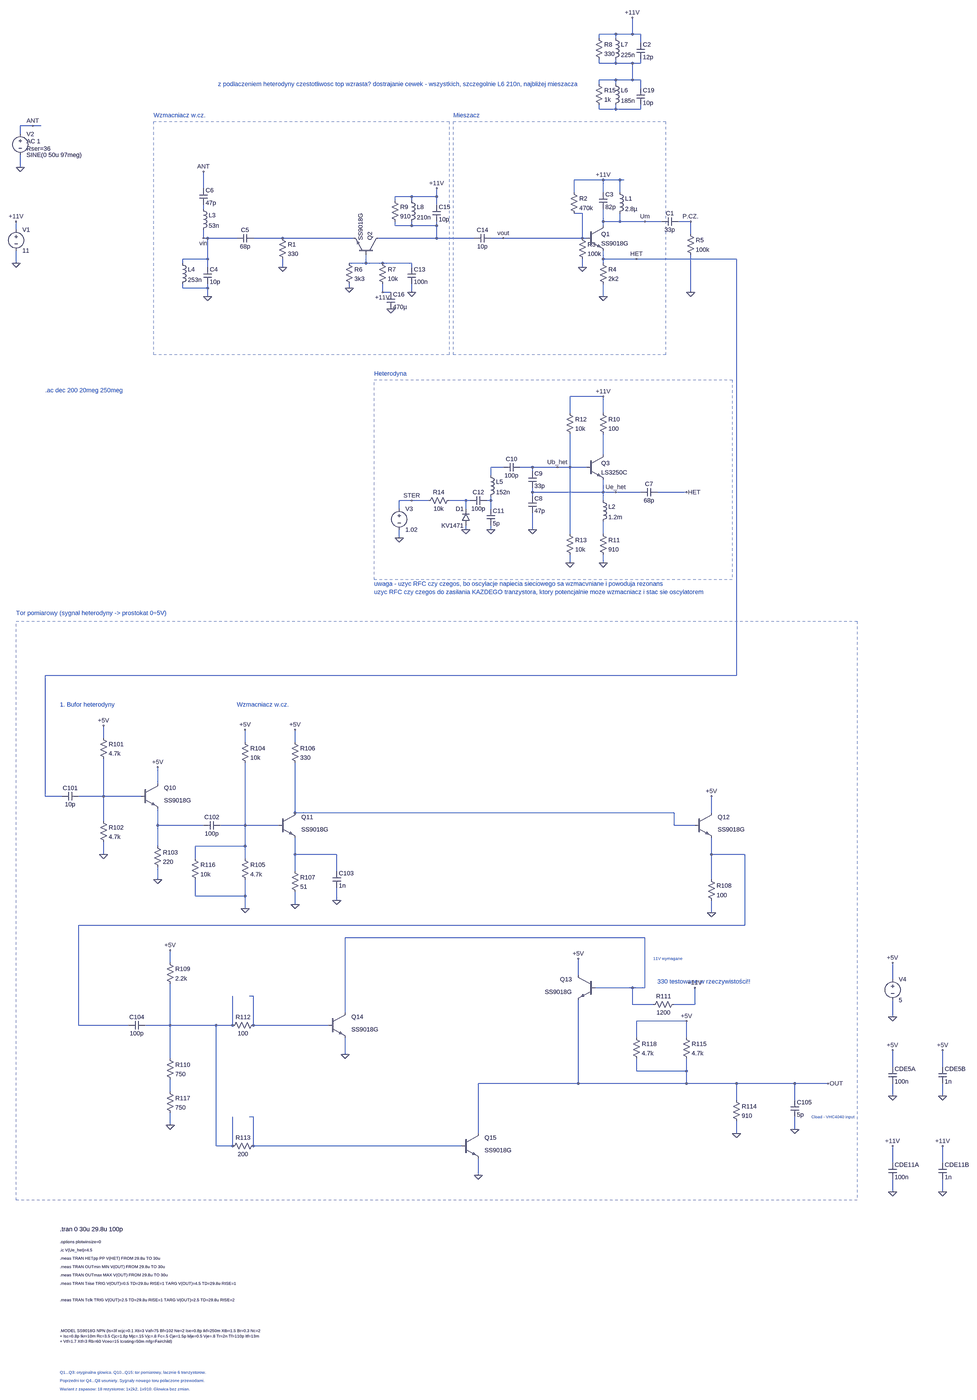
[diagram p0: schematic gt4_5.asc, whole sheet]
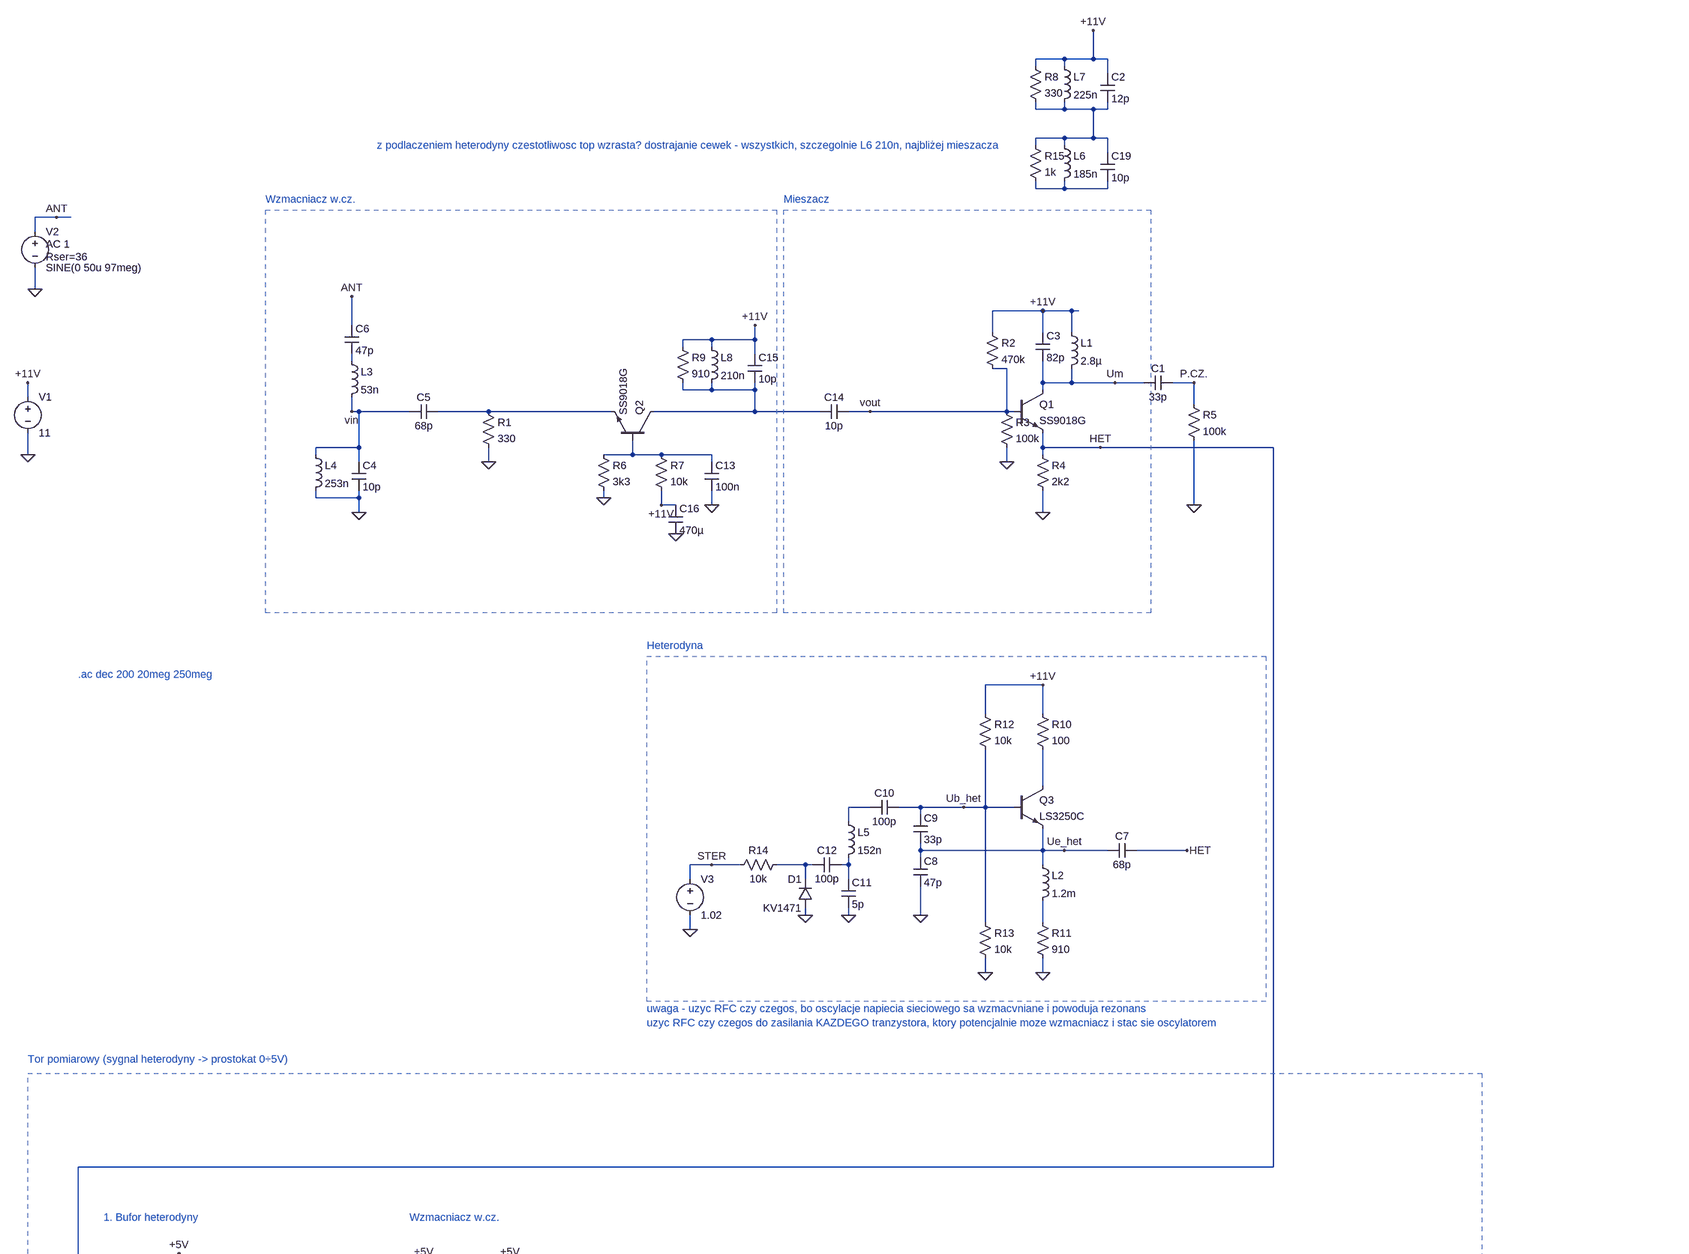
[diagram p1: schematic gt4_5.asc, part, row 1 of 2, column 1 of 1]
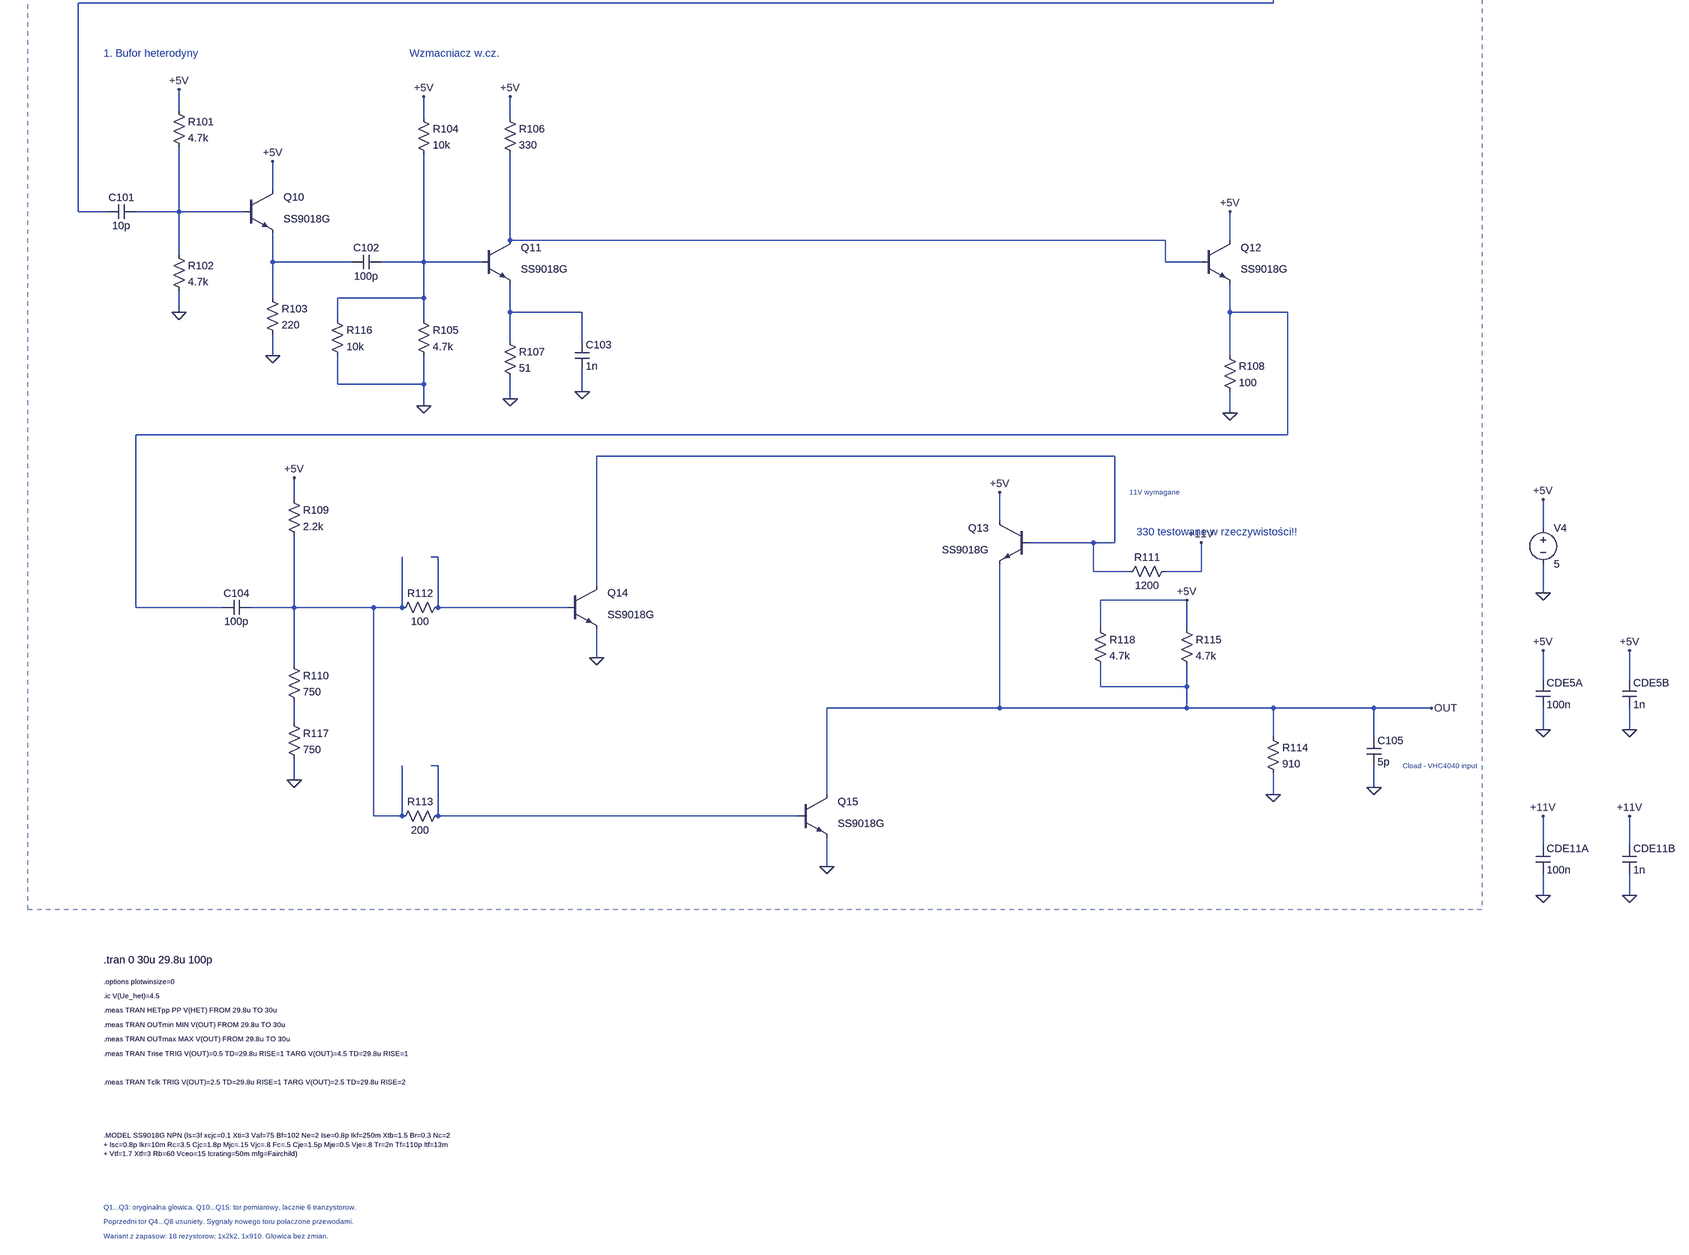
[diagram p2: schematic gt4_5.asc, part, row 2 of 2, column 1 of 1]
gt4_5.asc, the LTspice schematic file:
Version 4.1
SHEET 1 4160 5600
WIRE 336 -608 272 -608
WIRE 400 -608 400 -672
WIRE 400 -608 336 -608
WIRE 432 -608 400 -608
WIRE 272 -592 272 -608
WIRE 336 -592 336 -608
WIRE 432 -576 432 -608
WIRE 272 -496 272 -512
WIRE 336 -496 336 -512
WIRE 336 -496 272 -496
WIRE 400 -496 336 -496
WIRE 432 -496 432 -512
WIRE 432 -496 400 -496
WIRE 336 -432 272 -432
WIRE 400 -432 400 -496
WIRE 400 -432 336 -432
WIRE 432 -432 400 -432
WIRE 272 -416 272 -432
WIRE 336 -416 336 -432
WIRE 432 -400 432 -432
WIRE 272 -320 272 -336
WIRE 336 -320 336 -336
WIRE 336 -320 272 -320
WIRE 432 -320 432 -336
WIRE 432 -320 336 -320
WIRE -1904 -256 -1952 -256
WIRE -1872 -256 -1904 -256
WIRE -1952 -224 -1952 -256
WIRE -1952 -96 -1952 -144
WIRE 288 -48 176 -48
WIRE 352 -48 288 -48
WIRE 368 -48 352 -48
WIRE -1248 -16 -1248 -80
WIRE 176 0 176 -48
WIRE 288 0 288 -48
WIRE 352 0 352 -48
WIRE -448 16 -512 16
WIRE -352 16 -352 -16
WIRE -352 16 -448 16
WIRE -512 32 -512 16
WIRE -448 32 -448 16
WIRE -352 48 -352 16
WIRE -1248 64 -1248 48
WIRE 208 80 176 80
WIRE 288 112 288 64
WIRE 352 112 352 80
WIRE 352 112 288 112
WIRE 448 112 352 112
WIRE 512 112 448 112
WIRE 624 112 576 112
WIRE -512 128 -512 112
WIRE -448 128 -448 112
WIRE -448 128 -512 128
WIRE -352 128 -352 112
WIRE -352 128 -448 128
WIRE 288 128 288 112
WIRE -1968 144 -1968 112
WIRE 624 160 624 112
WIRE -1248 176 -1248 144
WIRE -1232 176 -1248 176
WIRE -1120 176 -1232 176
WIRE -944 176 -1056 176
WIRE -672 176 -944 176
WIRE -352 176 -352 128
WIRE -352 176 -576 176
WIRE -208 176 -352 176
WIRE -96 176 -144 176
WIRE 208 176 208 80
WIRE 208 176 -96 176
WIRE 224 176 208 176
WIRE -1232 256 -1232 176
WIRE -1232 256 -1328 256
WIRE 288 256 288 224
WIRE 416 256 288 256
WIRE 800 256 416 256
WIRE -1968 272 -1968 224
WIRE -1328 272 -1328 256
WIRE -624 272 -624 240
WIRE -624 272 -688 272
WIRE -560 272 -624 272
WIRE -448 272 -560 272
WIRE 288 272 288 256
WIRE -1232 288 -1232 256
WIRE -944 288 -944 256
WIRE -448 288 -448 272
WIRE 208 288 208 256
WIRE -1328 368 -1328 352
WIRE -1232 368 -1232 352
WIRE -1232 368 -1328 368
WIRE -688 368 -688 352
WIRE -560 384 -560 352
WIRE -528 384 -560 384
WIRE -448 384 -448 352
WIRE 624 384 624 240
WIRE -1232 400 -1232 368
WIRE 288 400 288 352
WIRE 288 784 160 784
WIRE 160 848 160 784
WIRE 288 848 288 784
WIRE 288 1008 288 928
WIRE -96 1056 -144 1056
WIRE 16 1056 -32 1056
WIRE 112 1056 16 1056
WIRE 160 1056 160 928
WIRE 160 1056 112 1056
WIRE 224 1056 160 1056
WIRE 16 1072 16 1056
WIRE -144 1088 -144 1056
WIRE 16 1152 16 1136
WIRE 288 1152 288 1104
WIRE 288 1152 16 1152
WIRE 336 1152 288 1152
WIRE 432 1152 336 1152
WIRE 608 1152 496 1152
WIRE 16 1168 16 1152
WIRE -448 1184 -496 1184
WIRE -384 1184 -448 1184
WIRE -240 1184 -304 1184
WIRE -224 1184 -240 1184
WIRE -144 1184 -144 1168
WIRE -144 1184 -160 1184
WIRE 288 1184 288 1152
WIRE -496 1216 -496 1184
WIRE -240 1216 -240 1184
WIRE -144 1216 -144 1184
WIRE -240 1296 -240 1280
WIRE -144 1296 -144 1280
WIRE 16 1296 16 1232
WIRE 160 1312 160 1056
WIRE 288 1312 288 1264
WIRE -496 1328 -496 1296
WIRE 160 1424 160 1392
WIRE 288 1424 288 1392
WIRE 800 1856 800 256
WIRE 800 1856 -1856 1856
WIRE -1632 2096 -1632 2048
WIRE -1088 2112 -1088 2064
WIRE -896 2112 -896 2064
WIRE -1424 2272 -1424 2208
WIRE -1856 2320 -1856 1856
WIRE -1792 2320 -1856 2320
WIRE -1632 2320 -1632 2176
WIRE -1632 2320 -1728 2320
WIRE -1488 2320 -1632 2320
WIRE -896 2384 -896 2192
WIRE 560 2384 -896 2384
WIRE 704 2384 704 2320
WIRE -1632 2416 -1632 2320
WIRE -1424 2432 -1424 2368
WIRE -1248 2432 -1424 2432
WIRE -1088 2432 -1088 2192
WIRE -1088 2432 -1184 2432
WIRE -960 2432 -1088 2432
WIRE 560 2432 560 2384
WIRE 640 2432 560 2432
WIRE -1424 2512 -1424 2432
WIRE -1088 2512 -1088 2432
WIRE -1088 2512 -1280 2512
WIRE -1632 2544 -1632 2496
WIRE -896 2544 -896 2480
WIRE -736 2544 -896 2544
WIRE 704 2544 704 2480
WIRE 832 2544 704 2544
WIRE -1280 2560 -1280 2512
WIRE -1088 2560 -1088 2512
WIRE -896 2608 -896 2544
WIRE -736 2608 -736 2544
WIRE -1424 2640 -1424 2592
WIRE 704 2640 704 2544
WIRE -1280 2704 -1280 2640
WIRE -1088 2704 -1088 2640
WIRE -1088 2704 -1280 2704
WIRE -736 2720 -736 2672
WIRE -896 2736 -896 2688
WIRE -1088 2752 -1088 2704
WIRE 704 2768 704 2720
WIRE 832 2816 832 2544
WIRE 832 2816 -1728 2816
WIRE 448 2864 -704 2864
WIRE -1376 2960 -1376 2912
WIRE 192 3008 192 2944
WIRE 1440 3024 1440 2960
WIRE 400 3056 256 3056
WIRE 448 3056 448 2864
WIRE 448 3056 400 3056
WIRE -1056 3088 -1072 3088
WIRE 400 3120 400 3056
WIRE 480 3120 400 3120
WIRE 640 3120 640 3056
WIRE 640 3120 560 3120
WIRE -704 3152 -704 2864
WIRE 1440 3168 1440 3104
WIRE 608 3184 416 3184
WIRE -1728 3200 -1728 2816
WIRE -1536 3200 -1728 3200
WIRE -1376 3200 -1376 3040
WIRE -1376 3200 -1472 3200
WIRE -1200 3200 -1376 3200
WIRE -1136 3200 -1136 3088
WIRE -1136 3200 -1200 3200
WIRE -1056 3200 -1056 3088
WIRE -768 3200 -1056 3200
WIRE 416 3248 416 3184
WIRE 608 3248 608 3184
WIRE -704 3312 -704 3248
WIRE -1376 3328 -1376 3200
WIRE 1440 3360 1440 3296
WIRE 1632 3360 1632 3296
WIRE 416 3376 416 3328
WIRE 608 3376 608 3328
WIRE 608 3376 416 3376
WIRE 192 3424 192 3104
WIRE 192 3424 -192 3424
WIRE 608 3424 608 3376
WIRE 608 3424 192 3424
WIRE 800 3424 608 3424
WIRE 1024 3424 800 3424
WIRE 1152 3424 1024 3424
WIRE -1376 3456 -1376 3408
WIRE 1440 3472 1440 3424
WIRE 1632 3472 1632 3424
WIRE 800 3488 800 3424
WIRE 1024 3488 1024 3424
WIRE -1056 3552 -1072 3552
WIRE -1376 3584 -1376 3536
WIRE 1024 3600 1024 3552
WIRE -192 3616 -192 3424
WIRE 800 3616 800 3568
WIRE -1200 3664 -1200 3200
WIRE -1136 3664 -1136 3552
WIRE -1136 3664 -1200 3664
WIRE -1056 3664 -1056 3552
WIRE -256 3664 -1056 3664
WIRE 1440 3728 1440 3664
WIRE 1632 3728 1632 3664
WIRE -192 3776 -192 3712
WIRE 1440 3840 1440 3792
WIRE 1632 3840 1632 3792
FLAG 624 384 0
FLAG 288 400 0
FLAG -1968 272 0
FLAG -1968 112 +11V
FLAG -1952 -96 0
FLAG -96 176 vout
FLAG 288 -48 +11V
FLAG -1248 -80 ANT
FLAG 160 1424 0
FLAG 288 1424 0
FLAG 608 1152 HET
FLAG 416 256 HET
FLAG 16 1296 0
FLAG -144 1296 0
FLAG -240 1296 0
FLAG -496 1328 0
FLAG -448 1184 STER
FLAG 288 784 +11V
FLAG 112 1056 Ub_het
FLAG 336 1152 Ue_het
FLAG 624 112 P.CZ.
FLAG 208 288 0
FLAG 448 112 Um
FLAG -1248 176 vin
FLAG -1904 -256 ANT
FLAG -944 288 0
FLAG -1232 400 0
FLAG -688 368 0
FLAG -560 384 +11V
FLAG -448 384 0
FLAG 400 -672 +11V
FLAG -352 -16 +11V
FLAG -528 448 0
FLAG -1424 2208 +5V
FLAG -1632 2048 +5V
FLAG -1632 2544 0
FLAG -1424 2640 0
FLAG -1088 2064 +5V
FLAG -1088 2752 0
FLAG -896 2064 +5V
FLAG -896 2736 0
FLAG -736 2720 0
FLAG 704 2320 +5V
FLAG 704 2768 0
FLAG -1376 2912 +5V
FLAG -1376 3584 0
FLAG -704 3312 0
FLAG -192 3776 0
FLAG 192 2944 +5V
FLAG 1152 3424 OUT
FLAG 640 3056 +11V
FLAG 608 3184 +5V
FLAG 800 3616 0
FLAG 1024 3600 0
FLAG 1440 2960 +5V
FLAG 1440 3168 0
FLAG 1440 3296 +5V
FLAG 1440 3472 0
FLAG 1632 3296 +5V
FLAG 1632 3472 0
FLAG 1440 3664 +11V
FLAG 1440 3840 0
FLAG 1632 3664 +11V
FLAG 1632 3840 0
SYMBOL npn 224 128 R0
SYMATTR InstName Q1
SYMATTR Value SS9018G
SYMBOL res 272 256 R0
SYMATTR InstName R4
SYMATTR Value 2k2
SYMBOL cap 576 96 R90
WINDOW 0 0 32 VBottom 2
WINDOW 3 32 32 VTop 2
SYMATTR InstName C1
SYMATTR Value 33p
SYMBOL res 608 144 R0
SYMATTR InstName R5
SYMATTR Value 100k
SYMBOL voltage -1968 128 R0
WINDOW 123 0 0 Left 0
WINDOW 39 0 0 Left 0
SYMATTR InstName V1
SYMATTR Value 11
SYMBOL voltage -1952 -240 R0
WINDOW 123 24 44 Left 2
WINDOW 39 24 72 Left 2
SYMATTR Value2 AC 1
SYMATTR SpiceLine Rser=36
SYMATTR InstName V2
SYMATTR Value SINE(0 50u 97meg)
SYMBOL npn -576 240 M270
SYMATTR InstName Q2
SYMATTR Value SS9018G
SYMBOL cap -1264 -16 R0
SYMATTR InstName C6
SYMATTR Value 47p
SYMBOL npn 224 1008 R0
SYMATTR InstName Q3
SYMATTR Value LS3250C
SYMBOL res 272 832 R0
SYMATTR InstName R10
SYMATTR Value 100
SYMBOL ind 272 1168 R0
SYMATTR InstName L2
SYMATTR Value 1.2m
SYMATTR SpiceLine Rser=1m
SYMBOL res 272 1296 R0
SYMATTR InstName R11
SYMATTR Value 910
SYMBOL res 144 832 R0
SYMATTR InstName R12
SYMATTR Value 10k
SYMBOL res 144 1296 R0
SYMATTR InstName R13
SYMATTR Value 10k
SYMBOL cap 496 1136 R90
WINDOW 0 0 32 VBottom 2
WINDOW 3 32 32 VTop 2
SYMATTR InstName C7
SYMATTR Value 68p
SYMBOL cap 0 1168 R0
SYMATTR InstName C8
SYMATTR Value 47p
SYMBOL cap 0 1072 R0
SYMATTR InstName C9
SYMATTR Value 33p
SYMBOL cap -32 1040 R90
WINDOW 0 0 32 VBottom 2
WINDOW 3 32 32 VTop 2
SYMATTR InstName C10
SYMATTR Value 100p
SYMBOL ind -160 1072 R0
SYMATTR InstName L5
SYMATTR Value 152n
SYMATTR SpiceLine Rser=1m
SYMBOL cap -160 1216 R0
SYMATTR InstName C11
SYMATTR Value 5p
SYMBOL diode -224 1280 R180
WINDOW 0 24 64 Left 2
WINDOW 3 24 0 Left 2
SYMATTR InstName D1
SYMATTR Value KV1471
SYMBOL voltage -496 1200 R0
WINDOW 123 0 0 Left 0
WINDOW 39 0 0 Left 0
SYMATTR InstName V3
SYMATTR Value 1.02
SYMBOL res -288 1168 R90
WINDOW 0 0 56 VBottom 2
WINDOW 3 32 56 VTop 2
SYMATTR InstName R14
SYMATTR Value 10k
SYMBOL cap -160 1168 R90
WINDOW 0 0 32 VBottom 2
WINDOW 3 32 32 VTop 2
SYMATTR InstName C12
SYMATTR Value 100p
SYMBOL res 160 -16 R0
SYMATTR InstName R2
SYMATTR Value 470k
SYMBOL res 192 160 R0
SYMATTR InstName R3
SYMATTR Value 100k
SYMBOL ind 336 -16 R0
SYMATTR InstName L1
SYMATTR Value 2.8µ
SYMATTR SpiceLine Rser=1m
SYMBOL cap 272 0 R0
SYMATTR InstName C3
SYMATTR Value 82p
SYMBOL ind -1264 48 R0
SYMATTR InstName L3
SYMATTR Value 53n
SYMATTR SpiceLine Rser=100m
SYMBOL cap -1056 160 R90
WINDOW 0 0 32 VBottom 2
WINDOW 3 32 32 VTop 2
SYMATTR InstName C5
SYMATTR Value 68p
SYMBOL res -960 160 R0
SYMATTR InstName R1
SYMATTR Value 330
SYMBOL ind -1344 256 R0
SYMATTR InstName L4
SYMATTR Value 253n
SYMATTR SpiceLine Rser=100m
SYMBOL cap -1248 288 R0
SYMATTR InstName C4
SYMATTR Value 10p
SYMBOL res -704 256 R0
SYMATTR InstName R6
SYMATTR Value 3k3
SYMBOL res -576 256 R0
SYMATTR InstName R7
SYMATTR Value 10k
SYMBOL cap -464 288 R0
SYMATTR InstName C13
SYMATTR Value 100n
SYMBOL ind 320 -432 R0
SYMATTR InstName L6
SYMATTR Value 185n
SYMATTR SpiceLine Rser=1m
SYMBOL cap 416 -400 R0
SYMATTR InstName C19
SYMATTR Value 10p
SYMBOL cap -144 160 R90
WINDOW 0 0 32 VBottom 2
WINDOW 3 32 32 VTop 2
SYMATTR InstName C14
SYMATTR Value 10p
SYMBOL res 256 -432 R0
SYMATTR InstName R15
SYMATTR Value 1k
SYMBOL ind 320 -608 R0
SYMATTR InstName L7
SYMATTR Value 225n
SYMATTR SpiceLine Rser=1m
SYMBOL cap 416 -576 R0
SYMATTR InstName C2
SYMATTR Value 12p
SYMBOL res 256 -608 R0
SYMATTR InstName R8
SYMATTR Value 330
SYMBOL ind -464 16 R0
SYMATTR InstName L8
SYMATTR Value 210n
SYMATTR SpiceLine Rser=1m
SYMBOL cap -368 48 R0
SYMATTR InstName C15
SYMATTR Value 10p
SYMBOL res -528 16 R0
SYMATTR InstName R9
SYMATTR Value 910
SYMBOL cap -544 384 R0
SYMATTR InstName C16
SYMATTR Value 470µ
SYMBOL cap -1728 2304 R90
WINDOW 0 0 32 VBottom 2
WINDOW 3 32 32 VTop 2
SYMATTR InstName C101
SYMATTR Value 10p
SYMBOL npn -1488 2272 R0
WINDOW 0 88 16 Left 2
WINDOW 3 88 64 Left 2
SYMATTR InstName Q10
SYMATTR Value SS9018G
SYMBOL res -1648 2080 R0
SYMATTR InstName R101
SYMATTR Value 4.7k
SYMBOL res -1648 2400 R0
SYMATTR InstName R102
SYMATTR Value 4.7k
SYMBOL res -1440 2496 R0
SYMATTR InstName R103
SYMATTR Value 220
SYMBOL cap -1184 2416 R90
WINDOW 0 0 32 VBottom 2
WINDOW 3 32 32 VTop 2
SYMATTR InstName C102
SYMATTR Value 100p
SYMBOL npn -960 2384 R0
WINDOW 0 88 16 Left 2
WINDOW 3 88 64 Left 2
SYMATTR InstName Q11
SYMATTR Value SS9018G
SYMBOL res -1104 2096 R0
SYMATTR InstName R104
SYMATTR Value 10k
SYMBOL res -1104 2544 R0
SYMATTR InstName R105
SYMATTR Value 4.7k
SYMBOL res -1296 2544 R0
SYMATTR InstName R116
SYMATTR Value 10k
SYMBOL res -912 2096 R0
SYMATTR InstName R106
SYMATTR Value 330
SYMBOL res -912 2592 R0
SYMATTR InstName R107
SYMATTR Value 51
SYMBOL cap -752 2608 R0
SYMATTR InstName C103
SYMATTR Value 1n
SYMBOL npn 640 2384 R0
WINDOW 0 88 16 Left 2
WINDOW 3 88 64 Left 2
SYMATTR InstName Q12
SYMATTR Value SS9018G
SYMBOL res 688 2624 R0
SYMATTR InstName R108
SYMATTR Value 100
SYMBOL cap -1472 3184 R90
WINDOW 0 0 32 VBottom 2
WINDOW 3 32 32 VTop 2
SYMATTR InstName C104
SYMATTR Value 100p
SYMBOL res -1392 2944 R0
SYMATTR InstName R109
SYMATTR Value 2.2k
SYMBOL res -1392 3312 R0
SYMATTR InstName R110
SYMATTR Value 750
SYMBOL res -1392 3440 R0
SYMATTR InstName R117
SYMATTR Value 750
SYMBOL res -1040 3184 R90
WINDOW 0 0 56 VBottom 2
WINDOW 3 32 56 VTop 2
SYMATTR InstName R112
SYMATTR Value 100
SYMBOL npn -768 3152 R0
WINDOW 0 88 16 Left 2
WINDOW 3 88 64 Left 2
SYMATTR InstName Q14
SYMATTR Value SS9018G
SYMBOL res -1040 3648 R90
WINDOW 0 0 56 VBottom 2
WINDOW 3 32 56 VTop 2
SYMATTR InstName R113
SYMATTR Value 200
SYMBOL npn -256 3616 R0
WINDOW 0 88 16 Left 2
WINDOW 3 88 64 Left 2
SYMATTR InstName Q15
SYMATTR Value SS9018G
SYMBOL npn 256 3008 M0
WINDOW 0 88 16 Left 2
WINDOW 3 88 64 Left 2
SYMATTR InstName Q13
SYMATTR Value SS9018G
SYMBOL res 576 3104 R90
WINDOW 0 0 56 VBottom 2
WINDOW 3 32 56 VTop 2
SYMATTR InstName R111
SYMATTR Value 1200
SYMBOL res 592 3232 R0
SYMATTR InstName R115
SYMATTR Value 4.7k
SYMBOL res 400 3232 R0
SYMATTR InstName R118
SYMATTR Value 4.7k
SYMBOL res 784 3472 R0
SYMATTR InstName R114
SYMATTR Value 910
SYMBOL cap 1008 3488 R0
SYMATTR InstName C105
SYMATTR Value 5p
SYMBOL voltage 1440 3008 R0
SYMATTR InstName V4
SYMATTR Value 5
SYMBOL cap 1424 3360 R0
SYMATTR InstName CDE5A
SYMATTR Value 100n
SYMBOL cap 1616 3360 R0
SYMATTR InstName CDE5B
SYMATTR Value 1n
SYMBOL cap 1424 3728 R0
SYMATTR InstName CDE11A
SYMATTR Value 100n
SYMBOL cap 1616 3728 R0
SYMATTR InstName CDE11B
SYMATTR Value 1n
TEXT -1856 760 Left 2 ;.ac dec 200 20meg 250meg
TEXT -1192 -416 Left 2 ;z podlaczeniem heterodyny czestotliwosc top wzrasta? dostrajanie cewek - wszystkich, szczegolnie L6 210n, najbliżej mieszacza
TEXT -592 1504 Left 2 ;uwaga - uzyc RFC czy czegos, bo oscylacje napiecia sieciowego sa wzmacvniane i powoduja rezonans\nuzyc RFC czy czegos do zasilania KAZDEGO tranzystora, ktory potencjalnie moze wzmacniacz i stac sie oscylatorem
TEXT -1800 1968 Left 2 ;1. Bufor heterodyny
TEXT -1120 1968 Left 2 ;Wzmacniacz w.cz.
TEXT 480 2944 Left 1 ;11V wymagane
TEXT 1088 3552 Left 1 ;Cload - VHC4040 input
TEXT -1800 4192 Left 2 !.tran 0 30u 29.8u 100p
TEXT -1800 4240 Left 1 !.options plotwinsize=0
TEXT -1800 4272 Left 1 !.ic V(Ue_het)=4.5
TEXT -1800 4304 Left 1 !.meas TRAN HETpp PP V(HET) FROM 29.8u TO 30u
TEXT -1800 4336 Left 1 !.meas TRAN OUTmin MIN V(OUT) FROM 29.8u TO 30u
TEXT -1800 4368 Left 1 !.meas TRAN OUTmax MAX V(OUT) FROM 29.8u TO 30u
TEXT -1800 4400 Left 1 !.meas TRAN Trise TRIG V(OUT)=0.5 TD=29.8u RISE=1 TARG V(OUT)=4.5 TD=29.8u RISE=1
TEXT -1800 4464 Left 1 !.meas TRAN Tclk TRIG V(OUT)=2.5 TD=29.8u RISE=1 TARG V(OUT)=2.5 TD=29.8u RISE=2
TEXT -1800 4640 Left 1 !.MODEL SS9018G NPN (Is=3f xcjc=0.1 Xti=3 Vaf=75 Bf=102 Ne=2 Ise=0.8p Ikf=250m Xtb=1.5 Br=0.3 Nc=2\n+ Isc=0.8p Ikr=10m Rc=3.5 Cjc=1.8p Mjc=.15 Vjc=.8 Fc=.5 Cje=1.5p Mje=0.5 Vje=.8 Tr=2n Tf=110p Itf=13m\n+ Vtf=1.7 Xtf=3 Rb=60 Vceo=15 Icrating=50m mfg=Fairchild)
TEXT -1800 4992 Left 1 ;Q1...Q3: oryginalna glowica. Q10...Q15: tor pomiarowy, lacznie 6 tranzystorow.
TEXT -1800 5024 Left 1 ;Poprzedni tor Q4...Q8 usuniety. Sygnaly nowego toru polaczone przewodami.
TEXT -1800 5056 Left 1 ;Wariant z zapasow: 18 rezystorow; 1x2k2, 1x910. Glowica bez zmian.
TEXT 496 3032 Left 2 ;330 testowane w rzeczywistości!!
TEXT -1440 -296 Left 2 ;Wzmacniacz w.cz.
TEXT -288 -296 Left 2 ;Mieszacz
TEXT -592 696 Left 2 ;Heterodyna
TEXT -1968 1616 Left 2 ;Tor pomiarowy (sygnal heterodyny -> prostokat 0÷5V)
RECTANGLE Normal -1440 -272 -304 624 2
RECTANGLE Normal -288 -272 528 624 2
RECTANGLE Normal -592 720 784 1488 2
RECTANGLE Normal -1440 -272 -304 624 2
RECTANGLE Normal -288 -272 528 624 2
RECTANGLE Normal -592 720 784 1488 2
RECTANGLE Normal 1264 3872 -1968 1648 2

The netlist it stands for:
* gt4_5.asc
Q1 Um vout HET 0 SS9018G
R4 HET 0 2k2
C1 P.CZ. Um 33p
R5 P.CZ. 0 100k
V1 +11V 0 11
V2 ANT 0 SINE(0 50u 97meg) AC 1 Rser=36
Q2 N004 N006 N005 0 SS9018G
C6 ANT N003 47p
Q3 N007 Ub_het Ue_het 0 LS3250C
R10 +11V N007 100
L2 Ue_het N011 1.2m Rser=1m
R11 N011 0 910
R12 +11V Ub_het 10k
R13 Ub_het 0 10k
C7 HET Ue_het 68p
C8 Ue_het 0 47p
C9 Ub_het Ue_het 33p
C10 Ub_het N008 100p
L5 N008 N010 152n Rser=1m
C11 N010 0 5p
D1 0 N009 KV1471
V3 STER 0 1.02
R14 N009 STER 10k
C12 N010 N009 100p
R2 +11V vout 470k
R3 vout 0 100k
L1 +11V Um 2.8µ Rser=1m
C3 +11V Um 82p
L3 N003 vin 53n Rser=100m
C5 N005 vin 68p
R1 N005 0 330
L4 vin 0 253n Rser=100m
C4 vin 0 10p
R6 N006 0 3k3
R7 N006 +11V 10k
C13 N006 0 100n
L6 N001 N002 185n Rser=1m
C19 N001 N002 10p
C14 vout N004 10p
R15 N001 N002 1k
L7 +11V N001 225n Rser=1m
C2 +11V N001 12p
R8 +11V N001 330
L8 +11V N004 210n Rser=1m
C15 +11V N004 10p
R9 +11V N004 910
C16 +11V 0 470µ
C101 N012 HET 10p
Q10 +5V N012 N014 0 SS9018G
R101 +5V N012 4.7k
R102 N012 0 4.7k
R103 N014 0 220
C102 N015 N014 100p
Q11 N013 N015 N016 0 SS9018G
R104 +5V N015 10k
R105 N015 0 4.7k
R116 N015 0 10k
R106 +5V N013 330
R107 N016 0 51
C103 N016 0 1n
Q12 +5V N013 N017 0 SS9018G
R108 N017 0 100
C104 N020 N017 100p
R109 +5V N020 2.2k
R110 N020 N021 750
R117 N021 0 750
R112 N019 N020 100
Q14 N018 N019 0 0 SS9018G
R113 N022 N020 200
Q15 OUT N022 0 0 SS9018G
Q13 +5V N018 OUT 0 SS9018G
R111 +11V N018 1200
R115 +5V OUT 4.7k
R118 +5V OUT 4.7k
R114 OUT 0 910
C105 OUT 0 5p
V4 +5V 0 5
CDE5A +5V 0 100n
CDE5B +5V 0 1n
CDE11A +11V 0 100n
CDE11B +11V 0 1n
.model D D
.lib standard.dio
.model NPN NPN
.model PNP PNP
.lib standard.bjt
* .ac dec 200 20meg 250meg
* z podlaczeniem heterodyny czestotliwosc top wzrasta? dostrajanie cewek - wszystkich, szczegolnie L6 210n, najbliżej mieszacza
* uwaga - uzyc RFC czy czegos, bo oscylacje napiecia sieciowego sa wzmacvniane i powoduja rezonans
* uzyc RFC czy czegos do zasilania KAZDEGO tranzystora, ktory potencjalnie moze wzmacniacz i stac sie oscylatorem
* 1. Bufor heterodyny
* Wzmacniacz w.cz.
* 11V wymagane
* Cload - VHC4040 input
.tran 0 30u 29.8u 100p
.options plotwinsize=0
.ic V(Ue_het)=4.5
.meas TRAN HETpp PP V(HET) FROM 29.8u TO 30u
.meas TRAN OUTmin MIN V(OUT) FROM 29.8u TO 30u
.meas TRAN OUTmax MAX V(OUT) FROM 29.8u TO 30u
.meas TRAN Trise TRIG V(OUT)=0.5 TD=29.8u RISE=1 TARG V(OUT)=4.5 TD=29.8u RISE=1
.meas TRAN Tclk TRIG V(OUT)=2.5 TD=29.8u RISE=1 TARG V(OUT)=2.5 TD=29.8u RISE=2
.MODEL SS9018G NPN (Is=3f xcjc=0.1 Xti=3 Vaf=75 Bf=102 Ne=2 Ise=0.8p Ikf=250m Xtb=1.5 Br=0.3 Nc=2
+ Isc=0.8p Ikr=10m Rc=3.5 Cjc=1.8p Mjc=.15 Vjc=.8 Fc=.5 Cje=1.5p Mje=0.5 Vje=.8 Tr=2n Tf=110p Itf=13m
+ Vtf=1.7 Xtf=3 Rb=60 Vceo=15 Icrating=50m mfg=Fairchild)
* Q1...Q3: oryginalna glowica. Q10...Q15: tor pomiarowy, lacznie 6 tranzystorow.
* Poprzedni tor Q4...Q8 usuniety. Sygnaly nowego toru polaczone przewodami.
* Wariant z zapasow: 18 rezystorow; 1x2k2, 1x910. Glowica bez zmian.
* 330 testowane w rzeczywistości!!
* Wzmacniacz w.cz.
* Mieszacz
* Heterodyna
* Tor pomiarowy (sygnal heterodyny -> prostokat 0÷5V)
.backanno
.end